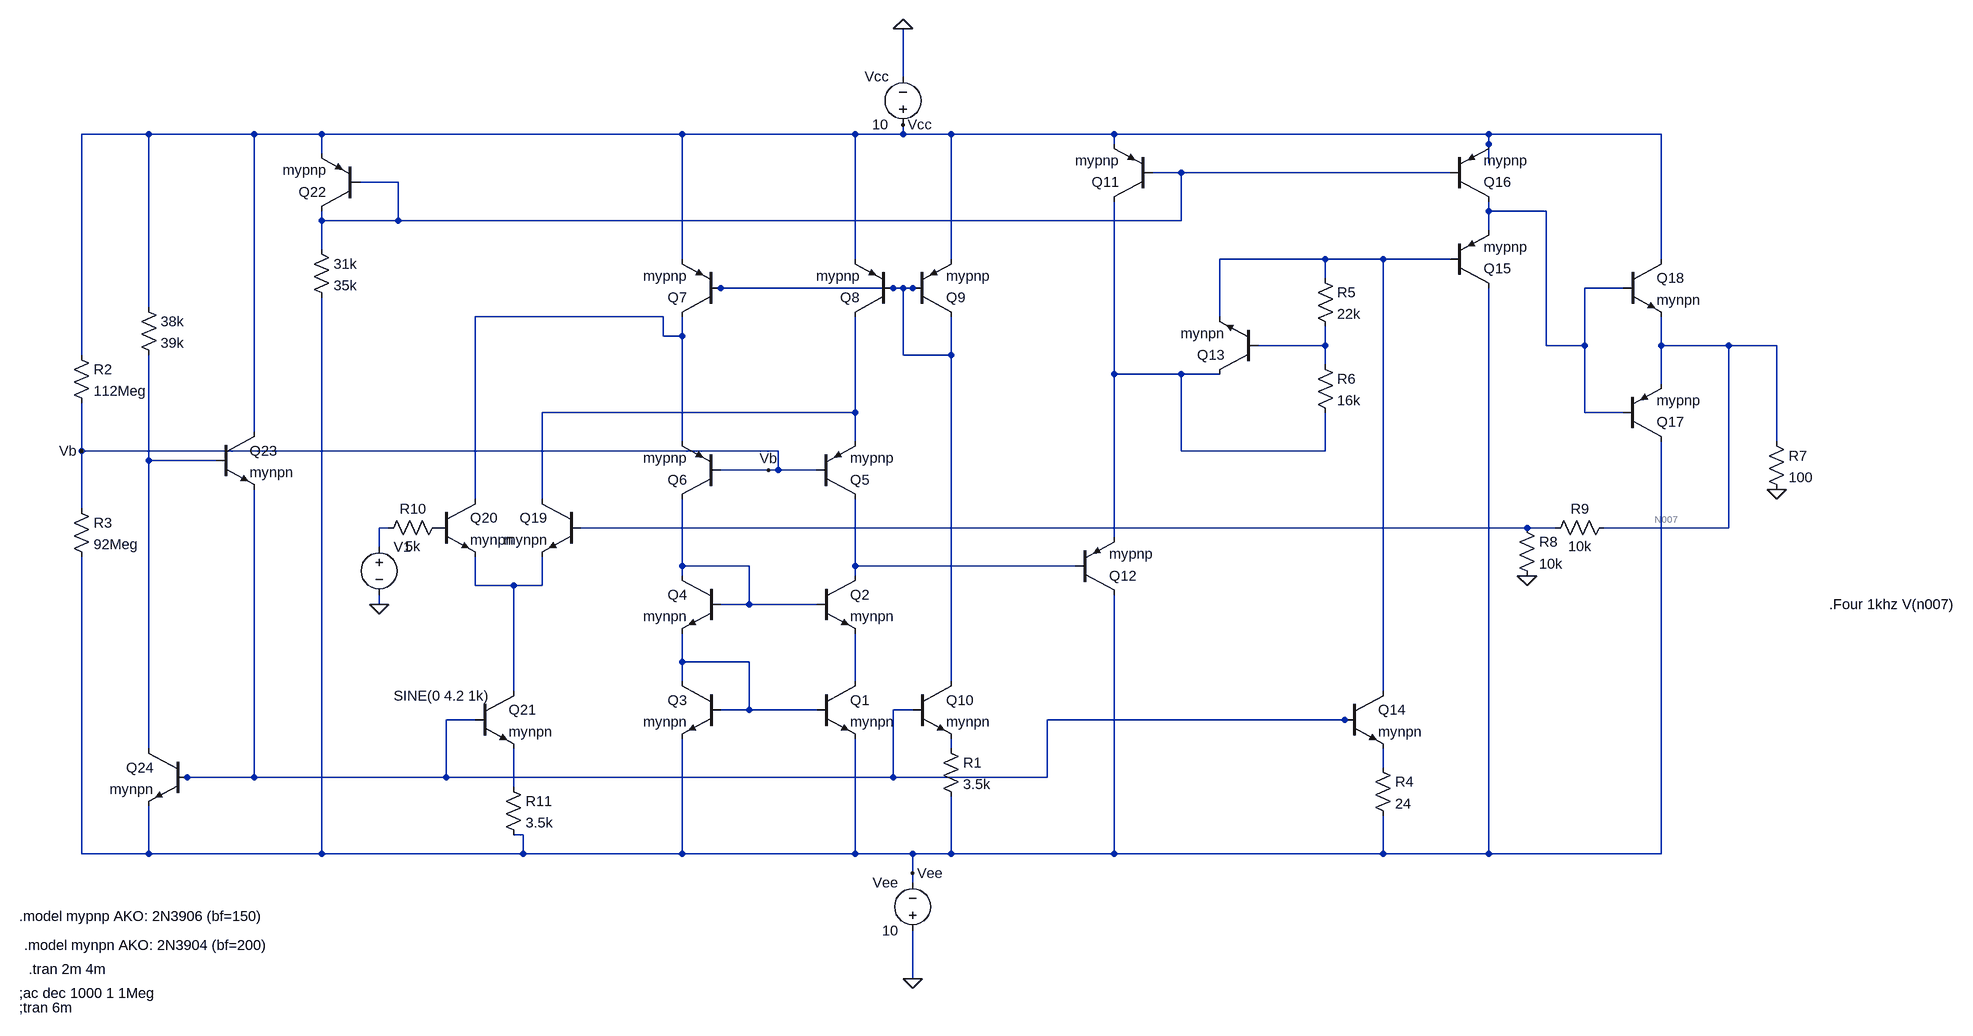
[diagram p0: schematic Q5.asc]
Q5.asc, the LTspice schematic file:
Version 4
SHEET 1 2620 788
WIRE 320 -784 320 -864
WIRE -1072 -688 -1184 -688
WIRE -896 -688 -1072 -688
WIRE -784 -688 -896 -688
WIRE -48 -688 -784 -688
WIRE 240 -688 -48 -688
WIRE 320 -688 320 -704
WIRE 320 -688 240 -688
WIRE 400 -688 320 -688
WIRE 672 -688 400 -688
WIRE 1296 -688 672 -688
WIRE 1584 -688 1296 -688
WIRE 672 -672 672 -688
WIRE 1296 -672 1296 -688
WIRE -784 -656 -784 -688
WIRE 1296 -640 1296 -672
WIRE 784 -624 736 -624
WIRE 1232 -624 784 -624
WIRE -656 -608 -720 -608
WIRE 1296 -560 1296 -576
WIRE 1392 -560 1296 -560
WIRE -784 -544 -784 -560
WIRE -656 -544 -656 -608
WIRE -656 -544 -784 -544
WIRE 784 -544 784 -624
WIRE 784 -544 -656 -544
WIRE 1296 -528 1296 -560
WIRE -784 -496 -784 -544
WIRE -48 -480 -48 -688
WIRE 240 -480 240 -688
WIRE 400 -480 400 -688
WIRE 1024 -480 848 -480
WIRE 1120 -480 1024 -480
WIRE 1232 -480 1120 -480
WIRE 1584 -480 1584 -688
WIRE 1024 -448 1024 -480
WIRE 16 -432 0 -432
WIRE 304 -432 16 -432
WIRE 320 -432 304 -432
WIRE 336 -432 320 -432
WIRE 352 -432 336 -432
WIRE 1520 -432 1456 -432
WIRE -1072 -400 -1072 -688
WIRE -80 -384 -528 -384
WIRE 848 -384 848 -480
WIRE -80 -352 -80 -384
WIRE -48 -352 -48 -384
WIRE -48 -352 -80 -352
WIRE 1024 -336 1024 -368
WIRE 1024 -336 912 -336
WIRE 1392 -336 1392 -560
WIRE 1456 -336 1456 -432
WIRE 1456 -336 1392 -336
WIRE 1584 -336 1584 -384
WIRE 1696 -336 1584 -336
WIRE 1776 -336 1696 -336
WIRE -1184 -320 -1184 -688
WIRE 320 -320 320 -432
WIRE 400 -320 400 -384
WIRE 400 -320 320 -320
WIRE 1024 -304 1024 -336
WIRE 672 -288 672 -576
WIRE 784 -288 672 -288
WIRE 848 -288 784 -288
WIRE 1584 -272 1584 -336
WIRE 240 -224 240 -384
WIRE 240 -224 -416 -224
WIRE 1456 -224 1456 -336
WIRE 1520 -224 1456 -224
WIRE -896 -192 -896 -688
WIRE -48 -176 -48 -352
WIRE 240 -176 240 -224
WIRE 1776 -176 1776 -336
WIRE -1184 -160 -1184 -240
WIRE 112 -160 -1184 -160
WIRE 784 -160 784 -288
WIRE 1024 -160 1024 -224
WIRE 1024 -160 784 -160
WIRE -1072 -144 -1072 -320
WIRE -960 -144 -1072 -144
WIRE 96 -128 16 -128
WIRE 112 -128 112 -160
WIRE 112 -128 96 -128
WIRE 176 -128 112 -128
WIRE -528 -80 -528 -384
WIRE -416 -80 -416 -224
WIRE -1184 -64 -1184 -160
WIRE -672 -32 -688 -32
WIRE 1360 -32 -352 -32
WIRE 1408 -32 1360 -32
WIRE 1696 -32 1696 -336
WIRE 1696 -32 1488 -32
WIRE 672 -16 672 -288
WIRE -688 0 -688 -32
WIRE -48 32 -48 -80
WIRE 64 32 -48 32
WIRE 240 32 240 -80
WIRE 608 32 240 32
WIRE -48 48 -48 32
WIRE 240 48 240 32
WIRE -528 64 -528 16
WIRE -464 64 -528 64
WIRE -416 64 -416 16
WIRE -416 64 -464 64
WIRE -688 96 -688 80
WIRE 64 96 64 32
WIRE 64 96 16 96
WIRE 176 96 64 96
WIRE -48 192 -48 144
WIRE 64 192 -48 192
WIRE -48 224 -48 192
WIRE 240 224 240 144
WIRE 400 224 400 -320
WIRE -464 240 -464 64
WIRE 1120 240 1120 -480
WIRE 64 272 64 192
WIRE 64 272 16 272
WIRE 176 272 64 272
WIRE 336 272 304 272
WIRE -528 288 -576 288
WIRE 1056 288 560 288
WIRE 1072 288 1056 288
WIRE -1072 336 -1072 -144
WIRE 400 336 400 320
WIRE 1120 368 1120 336
WIRE -1008 384 -1024 384
WIRE -896 384 -896 -96
WIRE -896 384 -1008 384
WIRE -576 384 -576 288
WIRE -576 384 -896 384
WIRE 304 384 304 272
WIRE 304 384 -576 384
WIRE 560 384 560 288
WIRE 560 384 304 384
WIRE -464 400 -464 336
WIRE -448 480 -464 480
WIRE -1184 512 -1184 16
WIRE -1072 512 -1072 432
WIRE -1072 512 -1184 512
WIRE -784 512 -784 -416
WIRE -784 512 -1072 512
WIRE -448 512 -448 480
WIRE -448 512 -784 512
WIRE -48 512 -48 320
WIRE -48 512 -448 512
WIRE 240 512 240 320
WIRE 240 512 -48 512
WIRE 336 512 240 512
WIRE 400 512 400 416
WIRE 400 512 336 512
WIRE 672 512 672 80
WIRE 672 512 400 512
WIRE 1120 512 1120 448
WIRE 1120 512 672 512
WIRE 1296 512 1296 -432
WIRE 1296 512 1120 512
WIRE 1584 512 1584 -176
WIRE 1584 512 1296 512
WIRE 336 544 336 512
WIRE 336 560 336 544
WIRE 336 720 336 640
FLAG 1776 -96 0
FLAG 1360 48 0
FLAG -688 96 0
FLAG -1184 -160 Vb
FLAG 96 -128 Vb
FLAG 336 720 0
FLAG 320 -864 0
FLAG 320 -704 Vcc
FLAG 336 544 Vee
SYMBOL npn 176 224 R0
SYMATTR InstName Q1
SYMATTR Value mynpn
SYMBOL npn 176 48 R0
SYMATTR InstName Q2
SYMATTR Value mynpn
SYMBOL npn 16 224 M0
SYMATTR InstName Q3
SYMATTR Value mynpn
SYMBOL npn 16 48 M0
SYMATTR InstName Q4
SYMATTR Value mynpn
SYMBOL pnp 176 -80 M180
SYMATTR InstName Q5
SYMATTR Value mypnp
SYMBOL pnp 16 -80 R180
SYMATTR InstName Q6
SYMATTR Value mypnp
SYMBOL pnp 16 -384 R180
SYMATTR InstName Q7
SYMATTR Value mypnp
SYMBOL pnp 304 -384 R180
SYMATTR InstName Q8
SYMATTR Value mypnp
SYMBOL pnp 336 -384 M180
SYMATTR InstName Q9
SYMATTR Value mypnp
SYMBOL npn 336 224 R0
SYMATTR InstName Q10
SYMATTR Value mynpn
SYMBOL pnp 736 -576 R180
SYMATTR InstName Q11
SYMATTR Value mypnp
SYMBOL pnp 608 80 M180
SYMATTR InstName Q12
SYMATTR Value mypnp
SYMBOL res 384 320 R0
SYMATTR InstName R1
SYMATTR Value 3.5k
SYMBOL npn 912 -288 R180
SYMATTR InstName Q13
SYMATTR Value mynpn
SYMBOL npn 1056 240 R0
SYMATTR InstName Q14
SYMATTR Value mynpn
SYMBOL res 1104 352 R0
SYMATTR InstName R4
SYMATTR Value 24
SYMBOL res 1008 -464 R0
SYMATTR InstName R5
SYMATTR Value 22k
SYMBOL res 1008 -320 R0
SYMATTR InstName R6
SYMATTR Value 16k
SYMBOL pnp 1232 -432 M180
SYMATTR InstName Q15
SYMATTR Value mypnp
SYMBOL pnp 1232 -576 M180
SYMATTR InstName Q16
SYMATTR Value mypnp
SYMBOL pnp 1520 -176 M180
SYMATTR InstName Q17
SYMATTR Value mypnp
SYMBOL npn 1520 -480 R0
SYMATTR InstName Q18
SYMATTR Value mynpn
SYMBOL res 1344 -48 R0
SYMATTR InstName R8
SYMATTR Value 10k
SYMBOL res 1504 -48 R90
WINDOW 0 0 56 VBottom 2
WINDOW 3 32 56 VTop 2
SYMATTR InstName R9
SYMATTR Value 10k
SYMBOL npn -352 -80 M0
SYMATTR InstName Q19
SYMATTR Value mynpn
SYMBOL npn -592 -80 R0
SYMATTR InstName Q20
SYMATTR Value mynpn
SYMBOL voltage -688 -16 R0
WINDOW 3 24 264 Left 2
WINDOW 123 24 236 Left 2
WINDOW 39 0 0 Left 0
SYMATTR Value SINE(0 4.2 1k)
SYMATTR InstName V1
SYMBOL res -576 -48 R90
WINDOW 0 0 56 VBottom 2
WINDOW 3 32 56 VTop 2
SYMATTR InstName R10
SYMATTR Value 5k
SYMBOL npn -528 240 R0
SYMATTR InstName Q21
SYMATTR Value mynpn
SYMBOL res -480 384 R0
SYMATTR InstName R11
SYMATTR Value 3.5k
SYMBOL pnp -720 -560 R180
SYMATTR InstName Q22
SYMATTR Value mypnp
SYMBOL res -800 -512 R0
SYMATTR InstName 31k
SYMATTR Value 35k
SYMBOL npn -960 -192 R0
SYMATTR InstName Q23
SYMATTR Value mynpn
SYMBOL npn -1008 336 M0
SYMATTR InstName Q24
SYMATTR Value mynpn
SYMBOL res -1088 -416 R0
SYMATTR InstName 38k
SYMATTR Value 39k
SYMBOL res 1760 -192 R0
SYMATTR InstName R7
SYMATTR Value 100
SYMBOL res -1200 -336 R0
SYMATTR InstName R2
SYMATTR Value 112Meg
SYMBOL res -1200 -80 R0
SYMATTR InstName R3
SYMATTR Value 92Meg
SYMBOL voltage 320 -688 R180
WINDOW 0 24 96 Left 2
WINDOW 3 24 16 Left 2
WINDOW 123 0 0 Left 0
WINDOW 39 0 0 Left 0
SYMATTR InstName Vcc
SYMATTR Value 10
SYMBOL voltage 336 656 R180
WINDOW 0 24 96 Left 2
WINDOW 3 24 16 Left 2
SYMATTR InstName Vee
SYMATTR Value 10
TEXT -1288 616 Left 2 !.model mypnp AKO: 2N3906 (bf=150)
TEXT -1280 664 Left 2 !.model mynpn AKO: 2N3904 (bf=200)
TEXT -1272 704 Left 2 !.tran 2m 4m
TEXT -1288 744 Left 2 !;ac dec 1000 1 1Meg
TEXT -1288 768 Left 2 !;tran 6m
TEXT 1864 96 Left 2 !.Four 1khz V(n007)

The netlist it stands for:
* Q5.asc
Q1 N017 N016 Vee 0 mynpn
Q2 N014 N013 N017 0 mynpn
Q3 N016 N016 Vee 0 mynpn
Q4 N013 N013 N016 0 mynpn
Q5 N014 Vb N009 0 mypnp
Q6 N013 Vb N005 0 mypnp
Q7 N005 N004 Vcc 0 mypnp
Q8 N009 N004 Vcc 0 mypnp
Q9 N004 N004 Vcc 0 mypnp
Q10 N004 N018 N019 0 mynpn
Q11 N008 N001 Vcc 0 mypnp
Q12 Vee N014 N008 0 mypnp
R1 N019 Vee 3.5k
Q13 N008 N006 N003 0 mynpn
Q14 N003 N018 N020 0 mynpn
R4 N020 Vee 24
R5 N003 N006 22k
R6 N006 N008 16k
Q15 Vee N003 N002 0 mypnp
Q16 N002 N001 Vcc 0 mypnp
Q17 Vee N002 N007 0 mypnp
Q18 Vcc N002 N007 0 mynpn
R8 N012 0 10k
R9 N007 N012 10k
Q19 N009 N012 N015 0 mynpn
Q20 N005 P001 N015 0 mynpn
V1 N011 0 SINE(0 4.2 1k)
R10 P001 N011 5k
Q21 N015 N018 N021 0 mynpn
R11 N021 Vee 3.5k
Q22 N001 N001 Vcc 0 mypnp
R§31k N001 Vee 35k
Q23 Vcc N010 N018 0 mynpn
Q24 N010 N018 Vee 0 mynpn
R§38k Vcc N010 39k
R7 N007 0 100
R2 Vcc Vb 112Meg
R3 Vb Vee 92Meg
Vcc Vcc 0 10
Vee 0 Vee 10
.model NPN NPN
.model PNP PNP
.lib standard.bjt
.model mypnp AKO: 2N3906 (bf=150)
.model mynpn AKO: 2N3904 (bf=200)
.tran 2m 4m
;ac dec 1000 1 1Meg
;tran 6m
.Four 1khz V(n007)
.backanno
.end